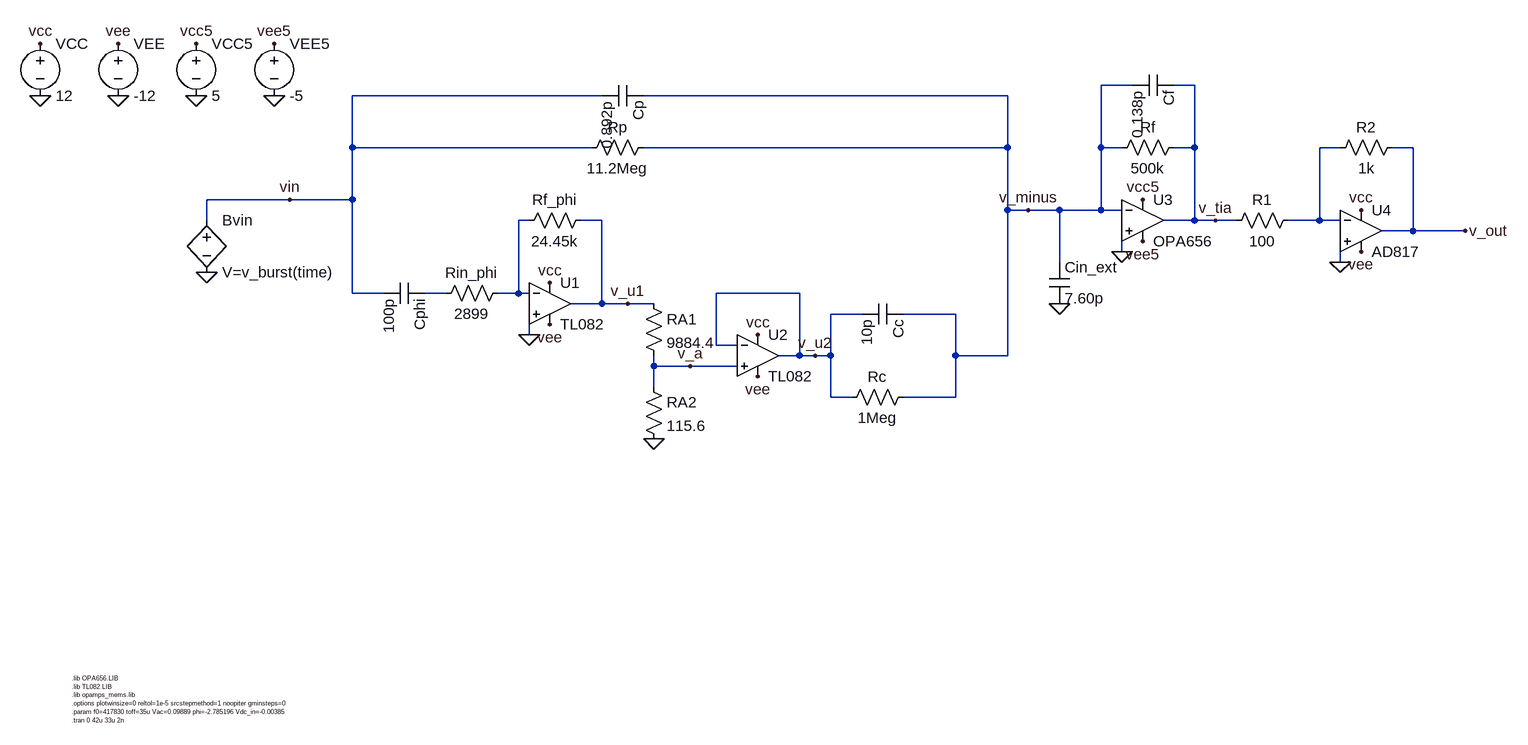
[diagram p0: schematic oscillazione_parassita.asc]
oscillazione_parassita.asc, the LTspice schematic file:
Version 4
SHEET 1 2160 860
WIRE -48 320 -48 352
WIRE 176 320 -48 320
WIRE 176 160 176 320
WIRE 560 160 176 160
WIRE 1184 160 624 160
WIRE 544 240 176 240
WIRE 1184 240 624 240
WIRE 1184 336 1184 160
WIRE 176 464 176 320
WIRE 224 464 176 464
WIRE 320 464 288 464
WIRE 448 464 400 464
WIRE 448 528 448 496
WIRE 432 352 432 464
WIRE 448 352 432 352
WIRE 560 352 528 352
WIRE 560 480 512 480
WIRE 560 480 560 352
WIRE 640 480 560 480
WIRE 640 608 640 560
WIRE 768 576 640 576
WIRE 864 560 832 560
WIRE 864 464 864 560
WIRE 736 464 864 464
WIRE 736 544 736 464
WIRE 768 544 736 544
WIRE 912 560 864 560
WIRE 912 496 912 560
WIRE 912 624 912 560
WIRE 960 496 912 496
WIRE 1104 496 1024 496
WIRE 944 624 912 624
WIRE 1104 624 1024 624
WIRE 1104 624 1104 496
WIRE 1184 560 1104 560
WIRE 1184 336 1184 560
WIRE 1360 336 1184 336
WIRE 1264 416 1264 336
WIRE 1360 400 1360 368
WIRE 1328 144 1328 336
WIRE 1360 240 1328 240
WIRE 1472 240 1440 240
WIRE 1376 144 1328 144
WIRE 1472 144 1440 144
WIRE 1472 352 1472 144
WIRE 1472 352 1424 352
WIRE 1536 352 1472 352
WIRE 1696 352 1616 352
WIRE 1696 416 1696 384
WIRE 1664 240 1664 352
WIRE 1696 240 1664 240
WIRE 1808 240 1776 240
WIRE 1888 368 1760 368
WIRE 1808 368 1808 240
FLAG -304 80 vcc
FLAG -304 160 0
FLAG -184 80 vee
FLAG -184 160 0
FLAG -64 80 vcc5
FLAG -64 160 0
FLAG 56 80 vee5
FLAG 56 160 0
FLAG 80 320 vin
FLAG -48 432 0
FLAG 480 448 vcc
FLAG 480 512 vee
FLAG 448 528 0
FLAG 600 480 v_u1
FLAG 696 576 v_a
FLAG 640 688 0
FLAG 800 528 vcc
FLAG 800 592 vee
FLAG 888 560 v_u2
FLAG 1216 336 v_minus
FLAG 1264 480 0
FLAG 1392 320 vcc5
FLAG 1392 384 vee5
FLAG 1360 400 0
FLAG 1504 352 v_tia
FLAG 1728 336 vcc
FLAG 1728 400 vee
FLAG 1696 416 0
FLAG 1888 368 v_out
SYMBOL voltage -304 64 R0
SYMATTR InstName VCC
SYMATTR Value 12
SYMBOL voltage -184 64 R0
SYMATTR InstName VEE
SYMATTR Value -12
SYMBOL voltage -64 64 R0
SYMATTR InstName VCC5
SYMATTR Value 5
SYMBOL voltage 56 64 R0
SYMATTR InstName VEE5
SYMATTR Value -5
SYMBOL bv -48 336 R0
SYMATTR InstName Bvin
SYMATTR Value V=v_burst(time)
SYMBOL cap 624 144 R90
SYMATTR InstName Cp
SYMATTR Value 0.892p
SYMBOL res 640 224 R90
WINDOW 0 0 56 VBottom 2
WINDOW 3 32 56 VTop 2
SYMATTR InstName Rp
SYMATTR Value 11.2Meg
SYMBOL cap 288 448 R90
SYMATTR InstName Cphi
SYMATTR Value 100p
SYMBOL res 416 448 R90
WINDOW 0 0 56 VBottom 2
WINDOW 3 32 56 VTop 2
SYMATTR InstName Rin_phi
SYMATTR Value 2899
SYMBOL OpAmps\opamp2 480 416 R0
SYMATTR InstName U1
SYMATTR Value TL082
SYMBOL res 544 336 R90
WINDOW 0 0 56 VBottom 2
WINDOW 3 32 56 VTop 2
SYMATTR InstName Rf_phi
SYMATTR Value 24.45k
SYMBOL res 624 464 R0
SYMATTR InstName RA1
SYMATTR Value 9884.4
SYMBOL res 624 592 R0
SYMATTR InstName RA2
SYMATTR Value 115.6
SYMBOL OpAmps\opamp2 800 496 R0
SYMATTR InstName U2
SYMATTR Value TL082
SYMBOL cap 1024 480 R90
SYMATTR InstName Cc
SYMATTR Value 10p
SYMBOL res 1040 608 R90
WINDOW 0 0 56 VBottom 2
WINDOW 3 32 56 VTop 2
SYMATTR InstName Rc
SYMATTR Value 1Meg
SYMBOL cap 1248 416 R0
SYMATTR InstName Cin_ext
SYMATTR Value 7.60p
SYMBOL OpAmps\opamp2 1392 288 R0
SYMATTR InstName U3
SYMATTR Value OPA656
SYMBOL res 1456 224 R90
WINDOW 0 0 56 VBottom 2
WINDOW 3 32 56 VTop 2
SYMATTR InstName Rf
SYMATTR Value 500k
SYMBOL cap 1440 128 R90
SYMATTR InstName Cf
SYMATTR Value 0.138p
SYMBOL res 1632 336 R90
WINDOW 0 0 56 VBottom 2
WINDOW 3 32 56 VTop 2
SYMATTR InstName R1
SYMATTR Value 100
SYMBOL OpAmps\opamp2 1728 304 R0
SYMATTR InstName U4
SYMATTR Value AD817
SYMBOL res 1792 224 R90
WINDOW 0 0 56 VBottom 2
WINDOW 3 32 56 VTop 2
SYMATTR InstName R2
SYMATTR Value 1k
TEXT -256 1056 Left 0 !.lib OPA656.LIB\n.lib TL082.LIB\n.lib opamps_mems.lib\n.options plotwinsize=0 reltol=1e-5 srcstepmethod=1 noopiter gminsteps=0\n.param f0=417830 toff=35u Vac=0.09889 phi=-2.785196 Vdc_in=-0.00385\n.tran 0 42u 33u 2n

The netlist it stands for:
* oscillazione_parassita.asc
VCC vcc 0 12
VEE vee 0 -12
VCC5 vcc5 0 5
VEE5 vee5 0 -5
Bvin vin 0 V=v_burst(time)
Cp v_minus vin 0.892p
Rp v_minus vin 11.2Meg
Cphi N001 vin 100p
Rin_phi N002 N001 2899
XU1 0 N002 vcc vee v_u1 TL082  ; pins In+ In- V+ V- OUT
Rf_phi v_u1 N002 24.45k
RA1 v_u1 v_a 9884.4
RA2 v_a 0 115.6
XU2 v_a v_u2 vcc vee v_u2 TL082  ; pins In+ In- V+ V- OUT
Cc v_minus v_u2 10p
Rc v_minus v_u2 1Meg
Cin_ext v_minus 0 7.60p
XU3 0 v_minus vcc5 vee5 v_tia OPA656  ; pins In+ In- V+ V- OUT
Rf v_tia v_minus 500k
Cf v_tia v_minus 0.138p
R1 N003 v_tia 100
XU4 0 N003 vcc vee v_out AD817  ; pins In+ In- V+ V- OUT
R2 v_out N003 1k
.lib OPA656.LIB
.lib TL082.LIB
.lib opamps_mems.lib
.options plotwinsize=0 reltol=1e-5 srcstepmethod=1 noopiter gminsteps=0
.param f0=417830 toff=35u Vac=0.09889 phi=-2.785196 Vdc_in=-0.00385
.tran 0 42u 33u 2n
.backanno
.end